# Altium schematic sheet TIE_2019_rezolvare_page_1.SchDoc
size A3; SheetNumber: 1; SheetTotal: 2
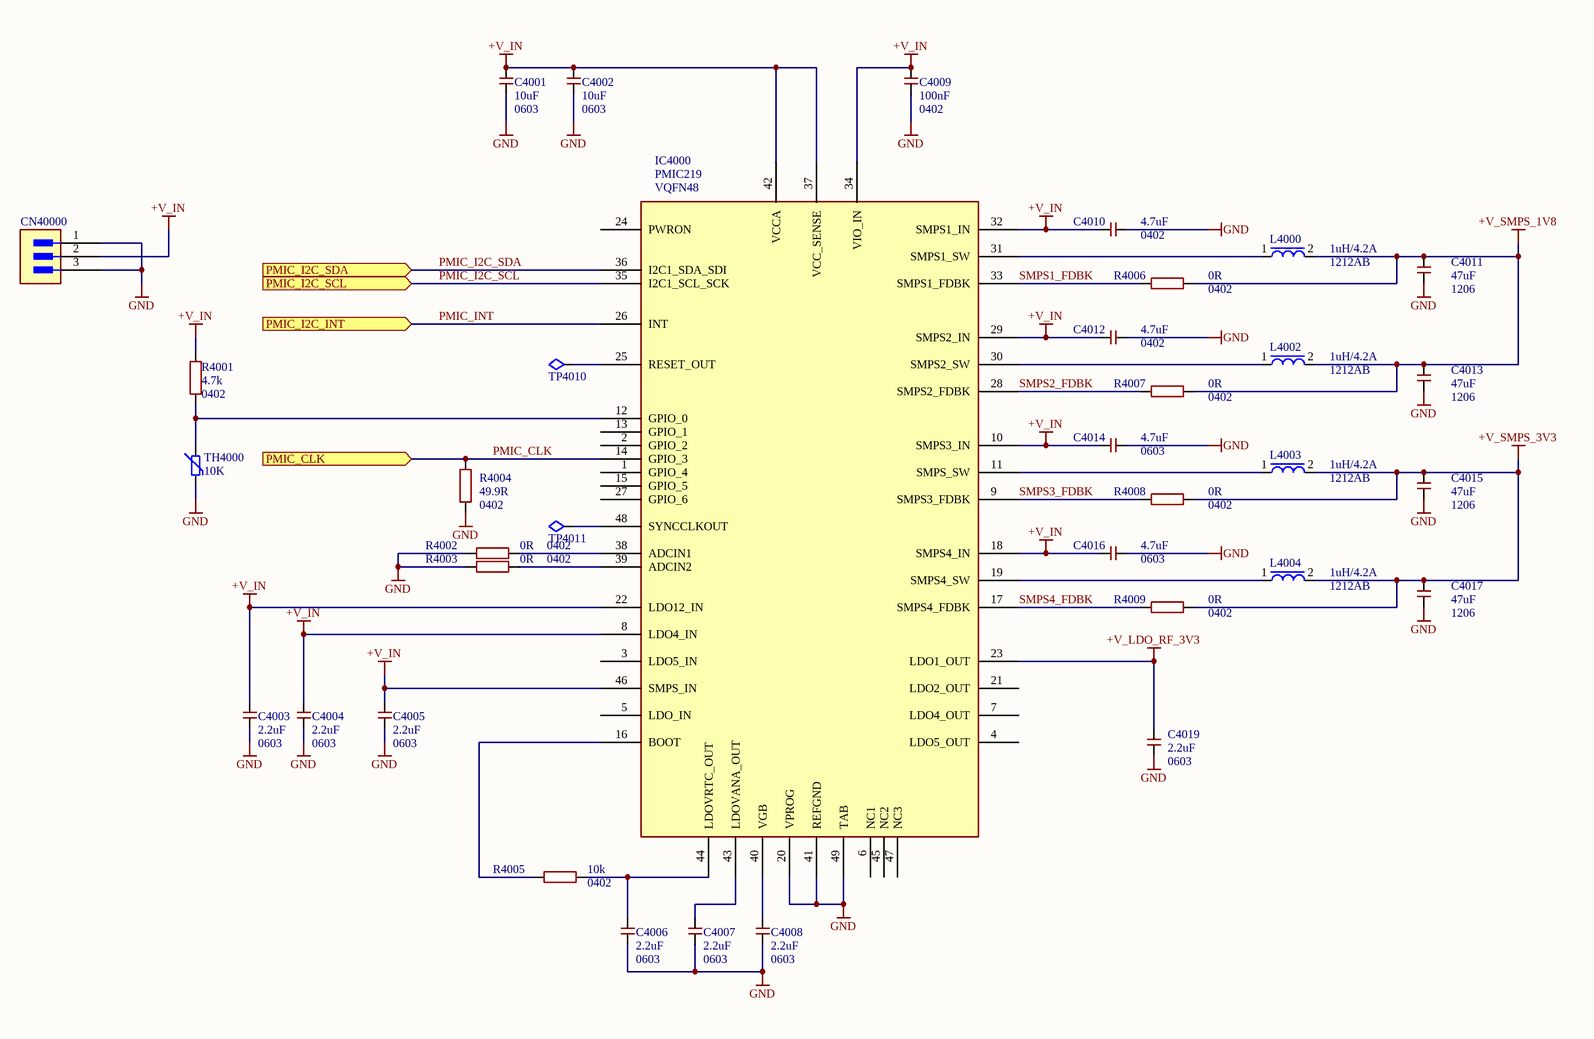
[diagram p0: TIE_2019_rezolvare_page_1.SchDoc]

## Parts
C4001  10uF  Footprint Name: 0603  [CAP0603]
C4002  10uF  Footprint Name: 0603  [CAP0603]
C4003  2.2uF  Footprint Name: 0603  [CAP0603]
C4004  2.2uF  Footprint Name: 0603  [CAP0603]
C4005  2.2uF  Footprint Name: 0603  [CAP0603]
C4006  2.2uF  Footprint Name: 0603  [CAP0603]
C4007  2.2uF  Footprint Name: 0603  [CAP0603]
C4008  2.2uF  Footprint Name: 0603  [CAP0603]
C4009  100nF  Footprint Name: 0402  [CAP0402]
C4010  4.7uF  Footprint Name: 0402  [CAP0402]
C4011  47uF  Footprint Name: 1206  [CAP1206]
C4012  4.7uF  Footprint Name: 0402  [CAP0402]
C4013  47uF  Footprint Name: 1206  [CAP1206]
C4014  4.7uF  Footprint Name: 0603  [CAP0603]
C4015  47uF  Footprint Name: 1206  [CAP1206]
C4016  4.7uF  Footprint Name: 0603  [CAP0603]
C4017  47uF  Footprint Name: 1206  [CAP1206]
C4019  2.2uF  Footprint Name: 0603  [CAP0603]
CN40000  Connector 1x3  [Conn1x03]  (value not drawn)
IC4000  PMIC219  Footprint: VQFN48  [48-QFN]
L4000  1uH/4.2A  Footprint: 1212AB  [L_1212AB]
L4002  1uH/4.2A  Footprint: 1212AB  [L_1212AB]
L4003  1uH/4.2A  Footprint: 1212AB  [L_1212AB]
L4004  1uH/4.2A  Footprint: 1212AB  [L_1212AB]
R4001  4.7k  Footprint Name: 0402  [RES0402]
R4002  0R  Footprint Name: 0402  [RES0402]
R4003  0R  Footprint Name: 0402  [RES0402]
R4004  49.9R  Footprint Name: 0402  [RES0402]
R4005  10k  Footprint Name: 0402  [RES0402]
R4006  0R  Footprint Name: 0402  [RES0402]
R4007  0R  Footprint Name: 0402  [RES0402]
R4008  0R  Footprint Name: 0402  [RES0402]
R4009  0R  Footprint Name: 0402  [RES0402]
TH4000  10K  [RES0402]
TP4010  TestPoint  [TestPoint_2019]  (value not drawn)  (no BOM)
TP4011  TestPoint  [TestPoint_2019]  (value not drawn)  (no BOM)

## Ports
PMIC_CLK (in, see TIE_2019_rezolvare_page_2[1B]), PMIC_I2C_INT (in, see TIE_2019_rezolvare_page_2[1B]), PMIC_I2C_SCL (in, see TIE_2019_rezolvare_page_2[1B]), PMIC_I2C_SDA (in, see TIE_2019_rezolvare_page_2[1B])

## Nets
+V_IN: C4001.2 C4002.2 C4003.2 C4004.1 C4005.1 C4009.2 C4010.1 C4012.1 C4014.1 C4016.1 CN40000.2 IC4000.8(LDO4_IN) IC4000.10(SMPS3_IN) IC4000.18(SMPS4_IN) IC4000.22(LDO12_IN) IC4000.29(SMPS2_IN) IC4000.32(SMPS1_IN) IC4000.34(VIO_IN) IC4000.37(VCC_SENSE) IC4000.42(VCCA) IC4000.46(SMPS_IN) R4001.2
+V_LDO_RF_3V3: C4019.2 IC4000.23(LDO1_OUT)
+V_SMPS_1V8: C4011.2 C4013.2 L4000.2 L4002.2 R4006.2 R4007.2
+V_SMPS_3V3: C4015.2 C4017.2 L4003.2 L4004.2 R4008.2 R4009.2
GND: C4001.1 C4002.1 C4003.1 C4004.2 C4005.2 C4006.1 C4007.1 C4008.1 C4009.1 C4010.2 C4011.1 C4012.2 C4013.1 C4014.2 C4015.1 C4016.2 C4017.1 C4019.1 CN40000.1 CN40000.3 IC4000.20(VPROG) IC4000.41(REFGND) IC4000.49(TAB) R4002.1 R4003.1 R4004.1 TH4000.1
PMIC_CLK: IC4000.14(GPIO_3) R4004.2 ; port PMIC_CLK
PMIC_I2C_SCL: IC4000.35(I2C1_SCL_SCK) ; port PMIC_I2C_SCL
PMIC_I2C_SDA: IC4000.36(I2C1_SDA_SDI) ; port PMIC_I2C_SDA
PMIC_INT: IC4000.26(INT) ; port PMIC_I2C_INT
SMPS1_FDBK: IC4000.33(SMPS1_FDBK) R4006.1
SMPS2_FDBK: IC4000.28(SMPS2_FDBK) R4007.1
SMPS3_FDBK: IC4000.9(SMPS3_FDBK) R4008.1
SMPS4_FDBK: IC4000.17(SMPS4_FDBK) R4009.1
NetC4006_2: C4006.2 IC4000.44(LDOVRTC_OUT) R4005.2
NetC4007_2: C4007.2 IC4000.43(LDOVANA_OUT)
NetC4008_2: C4008.2 IC4000.40(VGB)
NetIC4000_11: IC4000.11(SMPS_SW) L4003.1
NetIC4000_12: IC4000.12(GPIO_0) R4001.1 TH4000.2
NetIC4000_16: IC4000.16(BOOT) R4005.1
NetIC4000_19: IC4000.19(SMPS4_SW) L4004.1
NetIC4000_25: IC4000.25(RESET_OUT) TP4010.1
NetIC4000_30: IC4000.30(SMPS2_SW) L4002.1
NetIC4000_31: IC4000.31(SMPS1_SW) L4000.1
NetIC4000_38: IC4000.38(ADCIN1) R4002.2
NetIC4000_39: IC4000.39(ADCIN2) R4003.2
NetIC4000_48: IC4000.48(SYNCCLKOUT) TP4011.1

Not connected (* = marked no-connect by the designer): IC4000 1(GPIO_4) 2(GPIO_2) 3(LDO5_IN) 4(LDO5_OUT) 5(LDO_IN) 6(NC1) 7(LDO4_OUT) 13(GPIO_1) 15(GPIO_5) 21(LDO2_OUT) 24(PWRON) 27(GPIO_6) 45(NC2) 47(NC3)

## Library data of the parts
C4001 C4002 = C0603_10uF: CAP CER 10uF  SMD 0603; Manufacturer: Murata; Manufacturer Part Number: GJM1555C1H100JB01D
C4003-C4008 C4019 = C0603_2.2uF: CAP CER 2.2uF  SMD 0603; Manufacturer: Murata; Manufacturer Part Number: GJM1555C1H100JB01D
C4009 = C0402_100nF: CAP CER 100nF SMD 0402; Manufacturer: Murata; Manufacturer Part Number: GJM1555C1H100JB01D; Parameter 1: 50V
C4010 C4012 = C0402_4.7uF: CAP CER 4.7upF SMD 0402; Manufacturer: Murata; Manufacturer Part Number: GJM1555C1H100JB01D; Parameter 1: 50V
C4011 C4013 C4015 C4017 = C1206_47uF: CAP CER 47uF  SMD 1206; Manufacturer: Murata; Manufacturer Part Number: GJM1555C1H100JB01D
C4014 C4016 = C0603_4.7uF: CAP CER 4.7uF  SMD 0603; Manufacturer: Murata; Manufacturer Part Number: GJM1555C1H100JB01D
L4000 L4002-L4004 = IHLP1212AB
R4001 = R0402_4.7k: RES TKF 4.7k SMD 0402; Manufacturer: TE Connectivity; Manufacturer Part Number: CRG0402F10K; Tolerance: 1%
R4002 R4003 R4006-R4009 = R0402_0R: RES TKF 0R  SMD 0402; Manufacturer: TE Connectivity; Manufacturer Part Number: CRG0402F10K; Tolerance: 1%
R4004 = R0402_49.9R: RES TKF 49.9R SMD 0402; Manufacturer: TE Connectivity; Manufacturer Part Number: CRG0402F10K; Tolerance: 1%
R4005 = R0402_10k: RES TKF 10k  SMD 0402; Manufacturer: TE Connectivity; Manufacturer Part Number: CRG0402F10K; Tolerance: 1%
TH4000 = Thermistor: THERMISTOR 10K OHM  0402
TP4010 TP4011 = TestPoint: SMD test point; Manufacturer: NA; .Checked_PCB: AI; .Creator: RV; .Checked_SCH: AI; Manufacturer Part Number: NA